# Altium schematic sheet 660nm-LED-Sheet.SchDoc
size 420 x 297 mm; SheetNumber: 3; SheetTotal: 6
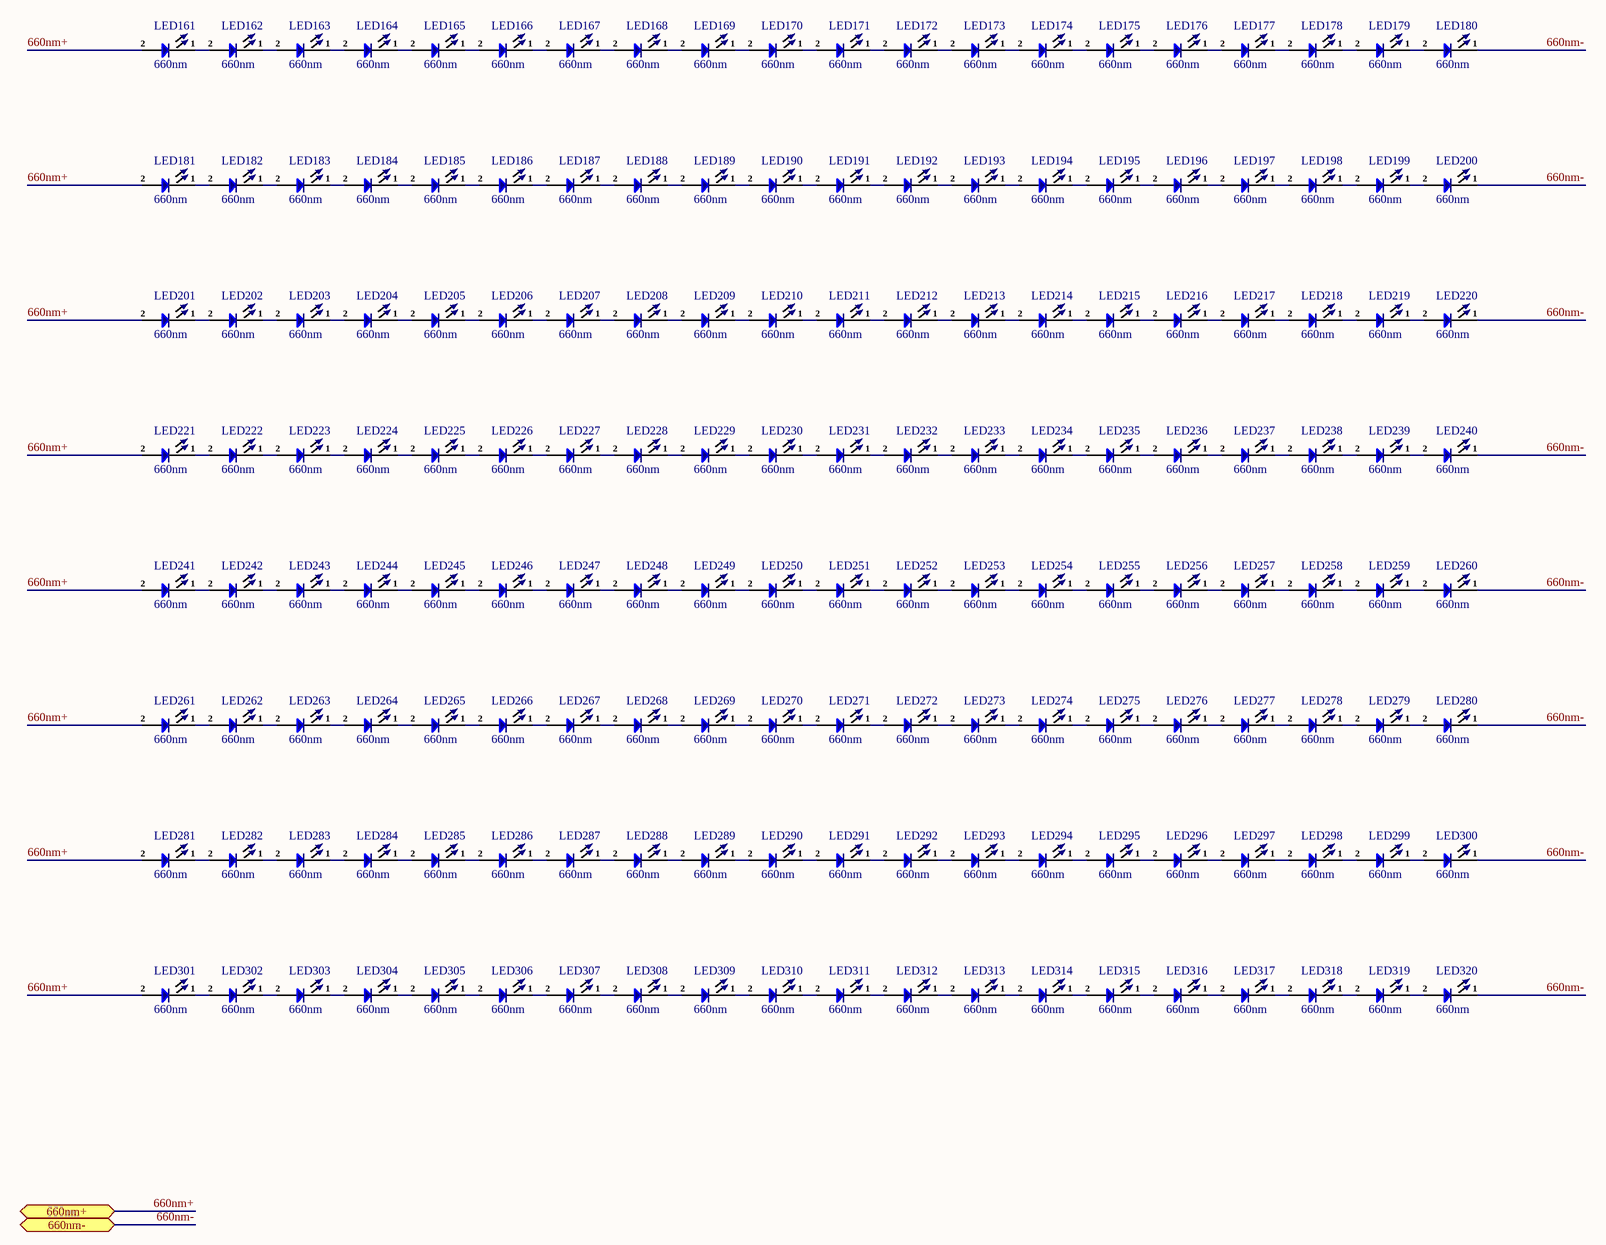
[diagram p0: 660nm-LED-Sheet.SchDoc]

## Parts
LED161  660nm  [TH LED 3mm_]
LED162  660nm  [TH LED 3mm_]
LED163  660nm  [TH LED 3mm_]
LED164  660nm  [TH LED 3mm_]
LED165  660nm  [TH LED 3mm_]
LED166  660nm  [TH LED 3mm_]
LED167  660nm  [TH LED 3mm_]
LED168  660nm  [TH LED 3mm_]
LED169  660nm  [TH LED 3mm_]
LED170  660nm  [TH LED 3mm_]
LED171  660nm  [TH LED 3mm_]
LED172  660nm  [TH LED 3mm_]
LED173  660nm  [TH LED 3mm_]
LED174  660nm  [TH LED 3mm_]
LED175  660nm  [TH LED 3mm_]
LED176  660nm  [TH LED 3mm_]
LED177  660nm  [TH LED 3mm_]
LED178  660nm  [TH LED 3mm_]
LED179  660nm  [TH LED 3mm_]
LED180  660nm  [TH LED 3mm_]
LED181  660nm  [TH LED 3mm_]
LED182  660nm  [TH LED 3mm_]
LED183  660nm  [TH LED 3mm_]
LED184  660nm  [TH LED 3mm_]
LED185  660nm  [TH LED 3mm_]
LED186  660nm  [TH LED 3mm_]
LED187  660nm  [TH LED 3mm_]
LED188  660nm  [TH LED 3mm_]
LED189  660nm  [TH LED 3mm_]
LED190  660nm  [TH LED 3mm_]
LED191  660nm  [TH LED 3mm_]
LED192  660nm  [TH LED 3mm_]
LED193  660nm  [TH LED 3mm_]
LED194  660nm  [TH LED 3mm_]
LED195  660nm  [TH LED 3mm_]
LED196  660nm  [TH LED 3mm_]
LED197  660nm  [TH LED 3mm_]
LED198  660nm  [TH LED 3mm_]
LED199  660nm  [TH LED 3mm_]
LED200  660nm  [TH LED 3mm_]
LED201  660nm  [TH LED 3mm_]
LED202  660nm  [TH LED 3mm_]
LED203  660nm  [TH LED 3mm_]
LED204  660nm  [TH LED 3mm_]
LED205  660nm  [TH LED 3mm_]
LED206  660nm  [TH LED 3mm_]
LED207  660nm  [TH LED 3mm_]
LED208  660nm  [TH LED 3mm_]
LED209  660nm  [TH LED 3mm_]
LED210  660nm  [TH LED 3mm_]
LED211  660nm  [TH LED 3mm_]
LED212  660nm  [TH LED 3mm_]
LED213  660nm  [TH LED 3mm_]
LED214  660nm  [TH LED 3mm_]
LED215  660nm  [TH LED 3mm_]
LED216  660nm  [TH LED 3mm_]
LED217  660nm  [TH LED 3mm_]
LED218  660nm  [TH LED 3mm_]
LED219  660nm  [TH LED 3mm_]
LED220  660nm  [TH LED 3mm_]
LED221  660nm  [TH LED 3mm_]
LED222  660nm  [TH LED 3mm_]
LED223  660nm  [TH LED 3mm_]
LED224  660nm  [TH LED 3mm_]
LED225  660nm  [TH LED 3mm_]
LED226  660nm  [TH LED 3mm_]
LED227  660nm  [TH LED 3mm_]
LED228  660nm  [TH LED 3mm_]
LED229  660nm  [TH LED 3mm_]
LED230  660nm  [TH LED 3mm_]
LED231  660nm  [TH LED 3mm_]
LED232  660nm  [TH LED 3mm_]
LED233  660nm  [TH LED 3mm_]
LED234  660nm  [TH LED 3mm_]
LED235  660nm  [TH LED 3mm_]
LED236  660nm  [TH LED 3mm_]
LED237  660nm  [TH LED 3mm_]
LED238  660nm  [TH LED 3mm_]
LED239  660nm  [TH LED 3mm_]
LED240  660nm  [TH LED 3mm_]
LED241  660nm  [TH LED 3mm_]
LED242  660nm  [TH LED 3mm_]
LED243  660nm  [TH LED 3mm_]
LED244  660nm  [TH LED 3mm_]
LED245  660nm  [TH LED 3mm_]
LED246  660nm  [TH LED 3mm_]
LED247  660nm  [TH LED 3mm_]
LED248  660nm  [TH LED 3mm_]
LED249  660nm  [TH LED 3mm_]
LED250  660nm  [TH LED 3mm_]
LED251  660nm  [TH LED 3mm_]
LED252  660nm  [TH LED 3mm_]
LED253  660nm  [TH LED 3mm_]
LED254  660nm  [TH LED 3mm_]
LED255  660nm  [TH LED 3mm_]
LED256  660nm  [TH LED 3mm_]
LED257  660nm  [TH LED 3mm_]
LED258  660nm  [TH LED 3mm_]
LED259  660nm  [TH LED 3mm_]
LED260  660nm  [TH LED 3mm_]
LED261  660nm  [TH LED 3mm_]
LED262  660nm  [TH LED 3mm_]
LED263  660nm  [TH LED 3mm_]
LED264  660nm  [TH LED 3mm_]
LED265  660nm  [TH LED 3mm_]
LED266  660nm  [TH LED 3mm_]
LED267  660nm  [TH LED 3mm_]
LED268  660nm  [TH LED 3mm_]
LED269  660nm  [TH LED 3mm_]
LED270  660nm  [TH LED 3mm_]
LED271  660nm  [TH LED 3mm_]
LED272  660nm  [TH LED 3mm_]
LED273  660nm  [TH LED 3mm_]
LED274  660nm  [TH LED 3mm_]
LED275  660nm  [TH LED 3mm_]
LED276  660nm  [TH LED 3mm_]
LED277  660nm  [TH LED 3mm_]
LED278  660nm  [TH LED 3mm_]
LED279  660nm  [TH LED 3mm_]
LED280  660nm  [TH LED 3mm_]
LED281  660nm  [TH LED 3mm_]
LED282  660nm  [TH LED 3mm_]
LED283  660nm  [TH LED 3mm_]
LED284  660nm  [TH LED 3mm_]
LED285  660nm  [TH LED 3mm_]
LED286  660nm  [TH LED 3mm_]
LED287  660nm  [TH LED 3mm_]
LED288  660nm  [TH LED 3mm_]
LED289  660nm  [TH LED 3mm_]
LED290  660nm  [TH LED 3mm_]
LED291  660nm  [TH LED 3mm_]
LED292  660nm  [TH LED 3mm_]
LED293  660nm  [TH LED 3mm_]
LED294  660nm  [TH LED 3mm_]
LED295  660nm  [TH LED 3mm_]
LED296  660nm  [TH LED 3mm_]
LED297  660nm  [TH LED 3mm_]
LED298  660nm  [TH LED 3mm_]
LED299  660nm  [TH LED 3mm_]
LED300  660nm  [TH LED 3mm_]
LED301  660nm  [TH LED 3mm_]
LED302  660nm  [TH LED 3mm_]
LED303  660nm  [TH LED 3mm_]
LED304  660nm  [TH LED 3mm_]
LED305  660nm  [TH LED 3mm_]
LED306  660nm  [TH LED 3mm_]
LED307  660nm  [TH LED 3mm_]
LED308  660nm  [TH LED 3mm_]
LED309  660nm  [TH LED 3mm_]
LED310  660nm  [TH LED 3mm_]
LED311  660nm  [TH LED 3mm_]
LED312  660nm  [TH LED 3mm_]
LED313  660nm  [TH LED 3mm_]
LED314  660nm  [TH LED 3mm_]
LED315  660nm  [TH LED 3mm_]
LED316  660nm  [TH LED 3mm_]
LED317  660nm  [TH LED 3mm_]
LED318  660nm  [TH LED 3mm_]
LED319  660nm  [TH LED 3mm_]
LED320  660nm  [TH LED 3mm_]

## Ports
660nm+ (bidir, see Main-Sheet[4A]), 660nm- (bidir, see Main-Sheet[4A])

## Nets
660nm+: LED161.2 LED181.2 LED201.2 LED221.2 LED241.2 LED261.2 LED281.2 LED301.2 ; port 660nm+
660nm-: LED180.1 LED200.1 LED220.1 LED240.1 LED260.1 LED280.1 LED300.1 LED320.1 ; port 660nm-
NetLED161_1: LED161.1 LED162.2
NetLED162_1: LED162.1 LED163.2
NetLED163_1: LED163.1 LED164.2
NetLED164_1: LED164.1 LED165.2
NetLED165_1: LED165.1 LED166.2
NetLED166_1: LED166.1 LED167.2
NetLED167_1: LED167.1 LED168.2
NetLED168_1: LED168.1 LED169.2
NetLED169_1: LED169.1 LED170.2
NetLED170_1: LED170.1 LED171.2
NetLED171_1: LED171.1 LED172.2
NetLED172_1: LED172.1 LED173.2
NetLED173_1: LED173.1 LED174.2
NetLED174_1: LED174.1 LED175.2
NetLED175_1: LED175.1 LED176.2
NetLED176_1: LED176.1 LED177.2
NetLED177_1: LED177.1 LED178.2
NetLED178_1: LED178.1 LED179.2
NetLED179_1: LED179.1 LED180.2
NetLED181_1: LED181.1 LED182.2
NetLED182_1: LED182.1 LED183.2
NetLED183_1: LED183.1 LED184.2
NetLED184_1: LED184.1 LED185.2
NetLED185_1: LED185.1 LED186.2
NetLED186_1: LED186.1 LED187.2
NetLED187_1: LED187.1 LED188.2
NetLED188_1: LED188.1 LED189.2
NetLED189_1: LED189.1 LED190.2
NetLED190_1: LED190.1 LED191.2
NetLED191_1: LED191.1 LED192.2
NetLED192_1: LED192.1 LED193.2
NetLED193_1: LED193.1 LED194.2
NetLED194_1: LED194.1 LED195.2
NetLED195_1: LED195.1 LED196.2
NetLED196_1: LED196.1 LED197.2
NetLED197_1: LED197.1 LED198.2
NetLED198_1: LED198.1 LED199.2
NetLED199_1: LED199.1 LED200.2
NetLED201_1: LED201.1 LED202.2
NetLED202_1: LED202.1 LED203.2
NetLED203_1: LED203.1 LED204.2
NetLED204_1: LED204.1 LED205.2
NetLED205_1: LED205.1 LED206.2
NetLED206_1: LED206.1 LED207.2
NetLED207_1: LED207.1 LED208.2
NetLED208_1: LED208.1 LED209.2
NetLED209_1: LED209.1 LED210.2
NetLED210_1: LED210.1 LED211.2
NetLED211_1: LED211.1 LED212.2
NetLED212_1: LED212.1 LED213.2
NetLED213_1: LED213.1 LED214.2
NetLED214_1: LED214.1 LED215.2
NetLED215_1: LED215.1 LED216.2
NetLED216_1: LED216.1 LED217.2
NetLED217_1: LED217.1 LED218.2
NetLED218_1: LED218.1 LED219.2
NetLED219_1: LED219.1 LED220.2
NetLED221_1: LED221.1 LED222.2
NetLED222_1: LED222.1 LED223.2
NetLED223_1: LED223.1 LED224.2
NetLED224_1: LED224.1 LED225.2
NetLED225_1: LED225.1 LED226.2
NetLED226_1: LED226.1 LED227.2
NetLED227_1: LED227.1 LED228.2
NetLED228_1: LED228.1 LED229.2
NetLED229_1: LED229.1 LED230.2
NetLED230_1: LED230.1 LED231.2
NetLED231_1: LED231.1 LED232.2
NetLED232_1: LED232.1 LED233.2
NetLED233_1: LED233.1 LED234.2
NetLED234_1: LED234.1 LED235.2
NetLED235_1: LED235.1 LED236.2
NetLED236_1: LED236.1 LED237.2
NetLED237_1: LED237.1 LED238.2
NetLED238_1: LED238.1 LED239.2
NetLED239_1: LED239.1 LED240.2
NetLED241_1: LED241.1 LED242.2
NetLED242_1: LED242.1 LED243.2
NetLED243_1: LED243.1 LED244.2
NetLED244_1: LED244.1 LED245.2
NetLED245_1: LED245.1 LED246.2
NetLED246_1: LED246.1 LED247.2
NetLED247_1: LED247.1 LED248.2
NetLED248_1: LED248.1 LED249.2
NetLED249_1: LED249.1 LED250.2
NetLED250_1: LED250.1 LED251.2
NetLED251_1: LED251.1 LED252.2
NetLED252_1: LED252.1 LED253.2
NetLED253_1: LED253.1 LED254.2
NetLED254_1: LED254.1 LED255.2
NetLED255_1: LED255.1 LED256.2
NetLED256_1: LED256.1 LED257.2
NetLED257_1: LED257.1 LED258.2
NetLED258_1: LED258.1 LED259.2
NetLED259_1: LED259.1 LED260.2
NetLED261_1: LED261.1 LED262.2
NetLED262_1: LED262.1 LED263.2
NetLED263_1: LED263.1 LED264.2
NetLED264_1: LED264.1 LED265.2
NetLED265_1: LED265.1 LED266.2
NetLED266_1: LED266.1 LED267.2
NetLED267_1: LED267.1 LED268.2
NetLED268_1: LED268.1 LED269.2
NetLED269_1: LED269.1 LED270.2
NetLED270_1: LED270.1 LED271.2
NetLED271_1: LED271.1 LED272.2
NetLED272_1: LED272.1 LED273.2
NetLED273_1: LED273.1 LED274.2
NetLED274_1: LED274.1 LED275.2
NetLED275_1: LED275.1 LED276.2
NetLED276_1: LED276.1 LED277.2
NetLED277_1: LED277.1 LED278.2
NetLED278_1: LED278.1 LED279.2
NetLED279_1: LED279.1 LED280.2
NetLED281_1: LED281.1 LED282.2
NetLED282_1: LED282.1 LED283.2
NetLED283_1: LED283.1 LED284.2
NetLED284_1: LED284.1 LED285.2
NetLED285_1: LED285.1 LED286.2
NetLED286_1: LED286.1 LED287.2
NetLED287_1: LED287.1 LED288.2
NetLED288_1: LED288.1 LED289.2
NetLED289_1: LED289.1 LED290.2
NetLED290_1: LED290.1 LED291.2
NetLED291_1: LED291.1 LED292.2
NetLED292_1: LED292.1 LED293.2
NetLED293_1: LED293.1 LED294.2
NetLED294_1: LED294.1 LED295.2
NetLED295_1: LED295.1 LED296.2
NetLED296_1: LED296.1 LED297.2
NetLED297_1: LED297.1 LED298.2
NetLED298_1: LED298.1 LED299.2
NetLED299_1: LED299.1 LED300.2
NetLED301_1: LED301.1 LED302.2
NetLED302_1: LED302.1 LED303.2
NetLED303_1: LED303.1 LED304.2
NetLED304_1: LED304.1 LED305.2
NetLED305_1: LED305.1 LED306.2
NetLED306_1: LED306.1 LED307.2
NetLED307_1: LED307.1 LED308.2
NetLED308_1: LED308.1 LED309.2
NetLED309_1: LED309.1 LED310.2
NetLED310_1: LED310.1 LED311.2
NetLED311_1: LED311.1 LED312.2
NetLED312_1: LED312.1 LED313.2
NetLED313_1: LED313.1 LED314.2
NetLED314_1: LED314.1 LED315.2
NetLED315_1: LED315.1 LED316.2
NetLED316_1: LED316.1 LED317.2
NetLED317_1: LED317.1 LED318.2
NetLED318_1: LED318.1 LED319.2
NetLED319_1: LED319.1 LED320.2

## Notes on the sheet
- File:
- Title:
- Date:
- Page
- Num:
- Total:
- Drawn By: Huzaifa Ali

## Library data of the parts
LED161-LED320 = IR LED 3mm: IR Led 3mm Through; ComponentLink1Description: Aliexpress; ComponentLink1URL: https://nl.aliexpress.com/item/32950109432.html?spm=a2g0o.productlist.0.0.2d9749ecxdTGvK&algo_pvid=f3c88197-d0dd-4360-badc-ef5a9d1d435b&algo_exp_id=f3c88197-d0dd-4360-badc-ef5a9d1d435b-1&pdp_ext_f=%7B%22sku_id%22%3A%2266309321327%22%7D